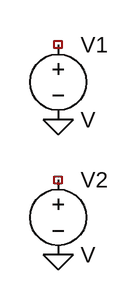
[diagram p0: schematic Signal Sources.asc]
Signal Sources.asc, the LTspice schematic file:
Version 4.1
SHEET 1 880 680
FLAG -16 128 0
FLAG -16 272 0
SYMBOL voltage -16 32 R0
SYMATTR InstName V1
SYMBOL voltage -16 176 R0
SYMATTR InstName V2

The netlist it stands for:
* Signal Sources.asc
V1 NC_01 0 V
V2 NC_02 0 V
.backanno
.end